# Altium schematic sheet POWER - SYSTEM POWER.schdoc
size 420 x 298 mm; Symbol: Sheet-Symbol_A3; Company: 嘉立创EDA; Version: V1.0; Page Size: A3; @Project Name: 【全网首发】X86电脑主板_copy; @Page Count: 27; @Update Date: 2025-10-09; @Create Date: 2025-10-09; @Schematic Name: SCHEMATIC1_1; @Page No: 0; @Page Name: POWER - SYSTEM POWER; Device: Sheet-Symbol_A3
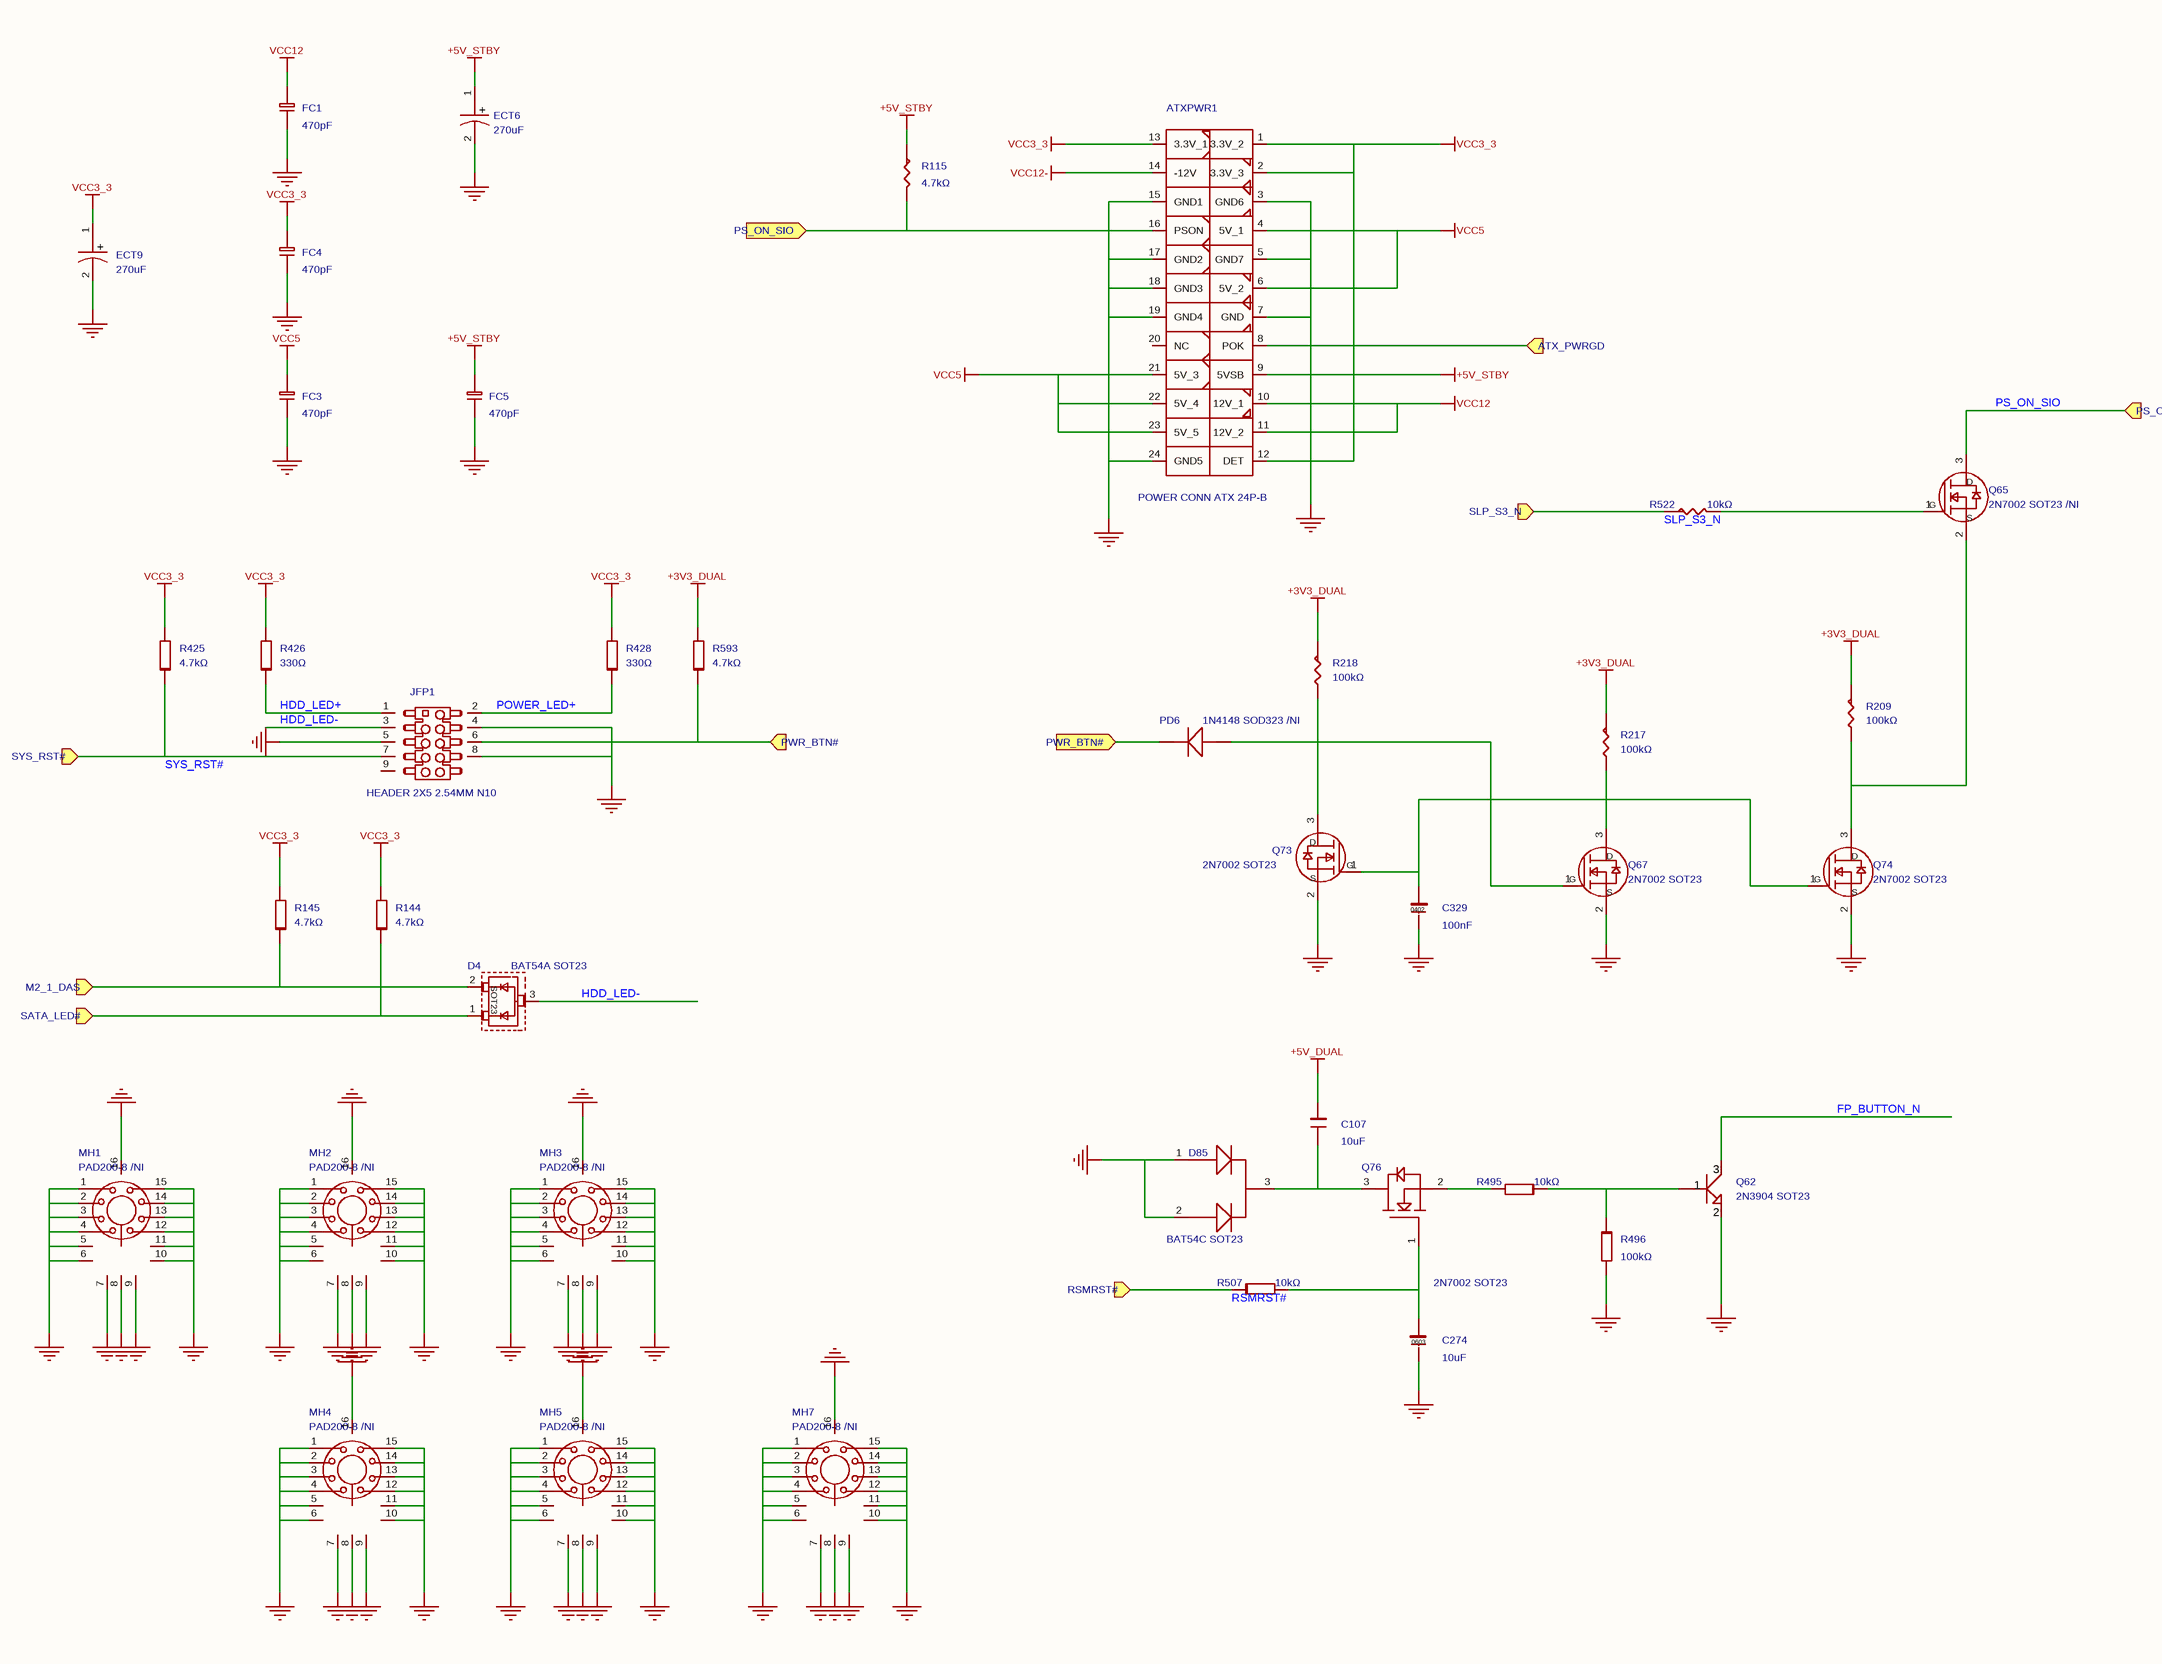
[diagram p0: POWER - SYSTEM POWER.schdoc]

## Parts
ATXPWR1  value POWER CONN ATX 24P-B  [POWER-PSU-20051014]  (hidden comment: 4-5099-8)
C107  10uF  [C0603_3]
C274  10uF  [C0603_3]
C329  100nF  [C0402]
D4  value BAT54A SOT23  [SOT23_123]  (hidden comment: BAT54A)
D85  value BAT54C SOT23  [SOT23_125]  (hidden comment: BAT54C)
ECT6  270uF  [EC1P25C_2]
ECT9  270uF  [EC1P25C_2]
FC1  470pF  [C0402_1]
FC3  470pF  [C0402_3]
FC4  470pF  [C0402_1]
FC5  470pF  [C0402_3]
JFP1  value HEADER 2X5 2.54MM N10  [PIN2X5_2D54_NC10_1]  (hidden comment: 210-92-05GB02)
MH1  value PAD200-8 /NI  [MTH_156A]  (hidden comment: Mounting Hole_0)
MH2  value PAD200-8 /NI  [MTH_156A]  (hidden comment: Mounting Hole_0)
MH3  value PAD200-8 /NI  [MTH_156A]  (hidden comment: Mounting Hole_0)
MH4  value PAD200-8 /NI  [MTH_156A]  (hidden comment: Mounting Hole_0)
MH5  value PAD200-8 /NI  [MTH_156A_1]  (hidden comment: Mounting Hole_0)
MH7  value PAD200-8 /NI  [MTH_156A_2]  (hidden comment: Mounting Hole_0)
PD6  value 1N4148 SOD323 /NI  [1N4148WS-7-SOD323]  (hidden comment: DIODE_1)
Q62  value 2N3904 SOT23  [SOT23_125]  (hidden comment: 2N3904S-RTK/PS)
Q65  value 2N7002 SOT23 /NI  [SOT23_125]  (hidden comment: NMOSFET SOT-23_0)
Q67  value 2N7002 SOT23  [SOT23_125]  (hidden comment: 2N7002)
Q73  value 2N7002 SOT23  [SOT23_126]  (hidden comment: 2N7002)
Q74  value 2N7002 SOT23  [SOT23_125]  (hidden comment: 2N7002)
Q76  value 2N7002 SOT23  [SOT23_125]  (hidden comment: 2N7002)
R115  4.7kΩ  [R0402_1]
R144  4.7kΩ  [R0402_1]
R145  4.7kΩ  [R0402_3]
R209  100kΩ  [R0402_1]
R217  100kΩ  [R0402]
R218  100kΩ  [R0402_1]
R425  4.7kΩ  [R0402_1]
R426  330Ω  [R0402_1]
R428  330Ω  [R0402_1]
R495  10kΩ  [R0402_3]
R496  100kΩ  [R0402_3]
R507  10kΩ  [R0402]
R522  10kΩ  [R0402_2]
R593  4.7kΩ  [R0402_1]

## Ports
ATX_PWRGD (in), M2_1_DAS (in), PS_ON_SIO (in), PWR_BTN# (in), RSMRST# (in), SATA_LED# (in), SLP_S3_N (in), SYS_RST# (in)

## Nets
+3V3_DUAL: R209.1 R217.1 R218.1 R593.2
+5V_DUAL: C107.1
+5V_STBY: ATXPWR1.9(5VSB) ECT6.1 FC5.1 R115.1
GND: ATXPWR1.3(GND6) ATXPWR1.5(GND7) ATXPWR1.7(GND) ATXPWR1.15(GND1) ATXPWR1.17(GND2) ATXPWR1.18(GND3) ATXPWR1.19(GND4) ATXPWR1.24(GND5) C274.2 C329.2 D85.1(A1) D85.2(A2) ECT6.2 ECT9.2 FC1.2 FC3.2 FC4.2 FC5.2 JFP1.4 JFP1.5 JFP1.8 MH1.1 MH1.2 MH1.3 MH1.4 MH1.5 MH1.6 MH1.7 MH1.8 MH1.9 MH1.10 MH1.11 MH1.12 MH1.13 MH1.14 MH1.15 MH1.16 MH2.1 MH2.2 MH2.3 MH2.4 MH2.5 MH2.6 MH2.7 MH2.8 MH2.9 MH2.10 MH2.11 MH2.12 MH2.13 MH2.14 MH2.15 MH2.16 MH3.1 MH3.2 MH3.3 MH3.4 MH3.5 MH3.6 MH3.7 MH3.8 MH3.9 MH3.10 MH3.11 MH3.12 MH3.13 MH3.14 MH3.15 MH3.16 MH4.1 MH4.2 MH4.3 MH4.4 MH4.5 MH4.6 MH4.7 MH4.8 MH4.9 MH4.10 MH4.11 MH4.12 MH4.13 MH4.14 MH4.15 MH4.16 MH5.1 MH5.2 MH5.3 MH5.4 MH5.5 MH5.6 MH5.7 MH5.8 MH5.9 MH5.10 MH5.11 MH5.12 MH5.13 MH5.14 MH5.15 MH5.16 MH7.1 MH7.2 MH7.3 MH7.4 MH7.5 MH7.6 MH7.7 MH7.8 MH7.9 MH7.10 MH7.11 MH7.12 MH7.13 MH7.14 MH7.15 MH7.16 Q62.2(E) Q67.2(S) Q73.2(S) Q74.2(S) R496.2
VCC3_3: ATXPWR1.1(3.3V_2) ATXPWR1.2(3.3V_3) ATXPWR1.12(DET) ATXPWR1.13(3.3V_1) ECT9.1 FC4.1 R144.2 R145.2 R425.2 R426.2 R428.2
VCC5: ATXPWR1.4(5V_1) ATXPWR1.6(5V_2) ATXPWR1.21(5V_3) ATXPWR1.22(5V_4) ATXPWR1.23(5V_5) FC3.1
VCC12: ATXPWR1.10(12V_1) ATXPWR1.11(12V_2) FC1.1
VCC12-: ATXPWR1.14(-12V)
ATX_PWRGD: ATXPWR1.8(POK) ; port ATX_PWRGD
FP_BUTTON_N: Q62.3(C)
HDD_LED+: JFP1.1 R426.1
HDD_LED-: D4.3 JFP1.3
M2_1_DAS: D4.2 R145.1 ; port M2_1_DAS
POWER_LED+: JFP1.2 R428.1
PS_ON_SIO: ATXPWR1.16(PSON) Q65.3(D) R115.2 ; port PS_ON_SIO
PWR_BTN#: JFP1.6 PD6.1(C) R593.1 ; port PWR_BTN#
RSMRST#: R507.1 ; port RSMRST#
SATA_LED#: D4.1 R144.1 ; port SATA_LED#
SLP_S3_N: R522.1 ; port SLP_S3_N
SYS_RST#: JFP1.7 R425.1 ; port SYS_RST#
NetC107_2: C107.2 D85.3(C) Q76.3(DRAIN)
NetC274_1: C274.1 Q76.1(GATE) R507.2
NetC329_1: C329.1 Q67.3(D) Q73.1(G) Q74.1(G) R217.2
NetPD6_2: PD6.2(A) Q67.1(G) Q73.3(D) R218.2
NetQ62_1: Q62.1(B) R495.1 R496.1
NetQ65_1: Q65.1(G) R522.2
NetQ65_2: Q65.2(S) Q74.3(D) R209.2
NetQ76_2: Q76.2(SOURCE) R495.2

Not connected (* = marked no-connect by the designer): ATXPWR1 20(NC); JFP1 9

## Notes on the sheet
- 更新日期
- 2025-10-09
- 原理图
- 图页
- SCHEMATIC1_1
- POWER - SYSTEM POWER
- 创建日期
- 物料编码
- 审阅
- 绘制
- 【全网首发】X86电脑主板_copy
- 版本
- V1.0
- 尺寸
- A3
- 页
- 0
- 嘉立创EDA
- 共
- 27
- (in symbol 160AREC271M0609) +
- (in symbol BAT54A_C727124) SOT23
- (in symbol CL05A106MQ5NUNC) 0603

## Library data of the parts
ATXPWR1 = 4-5099-8: 插针结构:2x12P;间距:4.2mm;安装方式:直插;参考系列:-;总PIN数:24P;排数:2;每排PIN数:12;行距:4.2mm;额定电流:9A;触头材质:黄铜;触头镀层:锡;工作温度范围:-25℃~+85℃;; Manufacturer: UMaxconn(友贸); Symbol: JATXPWR_0; AddInBom: yes; ModelId: 1f8e9fb6d80c412b94c4fc3963e9c297; ModelName: CONN-TH_4-5099-8; ModelTransform: 2041.334,429.133,0,0,0,0,-5.906,-25.591,-137.795; Pins Structure: 2x12P; Pitch: 4.2mm; Number of PINs Per Row: 12; Current Rating (Max): 9A; Device: 4-5099-8; LCSC Part Name: 2x12P 间距:4.2mm 直插; SupplierPart: C601194; ManufacturerPart: 4-5099-8; Supplier Footprint: 插件,P=4.2mm; JLCPCB Part Class: Extended Part; Datasheet: https://atta.szlcsc.com/upload/public/pdf/source/20200609/C601194_F0EB05AF17C99BA2D6678257B7A60494.pdf; Supplier: LCSC; ConvertToPcb: yes; FootprintName: POWER-PSU-20051014; Mounting Style: 直插; Reference Series: -; Number of Pins: 24P; Number of Rows: 2; Row Spacing: 4.2mm; Contact Material: 黄铜; Contact Plating: 锡; Operating Temperature Range: -25℃~+85℃
C107 = CL10A106MQ8NNNC: 容值:10uF;精度:±20%;额定电压:6.3V;材质(温度系数):X5R;; Manufacturer: SAMSUNG(三星); Symbol: C0805; ModelId: ac125912035d415993ca9572d50418b1; Tolerance: ±20%; AddInBom: yes; Voltage Rated: 6.3V; ModelName: C0603_L1.6-W0.8-H0.8; ModelTransform: 62.992,31.496,0,0,0,0,0,0,0; Temperature Coefficient: X5R; Device: CL10A106MQ8NNNC; Value: 10uF; Supplier: LCSC; Datasheet: https://atta.szlcsc.com/upload/public/pdf/source/20160103/1457707690948.pdf; FootprintName: C0603_3; SupplierPart: C1691; ConvertToPcb: yes; LCSC Part Name: 10uF ±20% 6.3V; JLCPCB Part Class: Extended Part; ManufacturerPart: CL10A106MQ8NNNC; Supplier Footprint: 0603
C274 = CL05A106MQ5NUNC: 容值:10uF;精度:±20%;额定电压:6.3V;材质(温度系数):X5R;; Manufacturer: SAMSUNG(三星); Symbol: C0603; ModelId: 36a51122f27c49738f86b3bfa98863e0; Tolerance: ±20%; AddInBom: yes; Voltage Rated: 6.3V; ModelName: C0402_L1.0-W0.5-H0.5; ModelTransform: 39.37,19.685,0,0,0,0,0,0,0; Temperature Coefficient: X5R; Device: CL05A106MQ5NUNC; Value: 10uF; Supplier: LCSC; Datasheet: https://atta.szlcsc.com/upload/public/pdf/source/20220823/2B02EE04F8F211D38A52DCB16EB6BEBA.pdf; FootprintName: C0603_3; SupplierPart: C15525; ConvertToPcb: yes; LCSC Part Name: 10uF ±20% 6.3V; JLCPCB Part Class: Basic Part; ManufacturerPart: CL05A106MQ5NUNC; Supplier Footprint: 0402
C329 = CL05B104KO5NNNC: 容值:100nF;精度:±10%;额定电压:16V;材质(温度系数):X7R;; Manufacturer: SAMSUNG(三星); ModelId: 36a51122f27c49738f86b3bfa98863e0; Tolerance: ±10%; AddInBom: yes; Voltage Rated: 16V; ModelName: C0402_L1.0-W0.5-H0.5; ModelTransform: 39.37,19.685,0,0,0,0,0,0,0; Temperature Coefficient: X7R; Device: CL05B104KO5NNNC; Symbol: C0402; Value: 100nF; Supplier: LCSC; Datasheet: https://atta.szlcsc.com/upload/public/pdf/source/20160103/1457707674891.pdf; FootprintName: C0402; SupplierPart: C1525; ConvertToPcb: yes; LCSC Part Name: 100nF ±10% 16V; JLCPCB Part Class: Basic Part; ManufacturerPart: CL05B104KO5NNNC; Supplier Footprint: 0402
D4 = BAT54A_C727124: 二极管配置:1对共阳极;正向压降(Vf):1V@100mA;直流反向耐压(Vr):30V;平均整流电流(Io):200mA;; Manufacturer: TWGMC(台湾迪嘉); AddInBom: yes; ModelId: c62791f0466c4ae2a892c056b845b0ca; ModelName: SOT-23-3P_L2.9-W1.3-H1.0-LS2.4-P0.95; ModelTransform: 98.425,114.173,0,180,0,0,0.0005,-0.0005,0; Diode Configuration: 1对共阳极; Reverse Voltage (Vr): 30V; Average Rectified Current (Io): 200mA; Reverse Leakage Current (Ir): 2uA@25V; Device: BAT54A_C727124; Symbol: BAT54A; LCSC Part Name: 电压:30V 电流:200mA; SupplierPart: C727124; ManufacturerPart: BAT54A; Supplier Footprint: SOT-23; JLCPCB Part Class: Extended Part; Datasheet: https://atta.szlcsc.com/upload/public/pdf/source/20200827/C727124_5D482B6B1AEFE8F49931502BEAC75010.pdf; Supplier: LCSC; ConvertToPcb: yes; FootprintName: SOT23_123; Forward Voltage (Vf@If): 1V@100mA
D85 = BAT54C_C2135: 二极管配置:-;直流反向耐压(Vr):30V;平均整流电流(Io):200mA;正向压降(Vf):1V@100mA;; Manufacturer: CJ(江苏长电/长晶); Symbol: BAT54C_1; ModelId: 89cb27a44ab2466697082bb9fd73a7d0; AddInBom: yes; ModelName: SOT-23-3L_L2.9-W1.6-H1.1-LS2.8-P0.95; ModelTransform: 110.236,114.173,0,180,0,0,-0.005,0.0005,0; Reverse Voltage (Vr): 30V; Average Rectified Current (Io): 200mA; Device: BAT54C_C2135; Supplier: LCSC; Datasheet: https://atta.szlcsc.com/upload/public/pdf/source/20140809/1457707208935.pdf; FootprintName: SOT23_125; SupplierPart: C2135; ConvertToPcb: yes; LCSC Part Name: 30V 200mA 1V@100mA; JLCPCB Part Class: Extended Part; ManufacturerPart: BAT54C; Supplier Footprint: SOT-23; Diode Configuration: -; Forward Voltage (Vf@If): 1V@100mA; Reverse Leakage Current (Ir): -
ECT6 ECT9 = 160AREC271M0609: 容值:270uF;精度:±20%;额定电压:16V;纹波电流:3.8A@100kHz;等效串联电阻:15mΩ@100kHz~300kHz;类型:-;; Manufacturer: APAQ(钰邦); Symbol: CAPACITOR POL_0; AddInBom: yes; ModelId: 0a4db4bf24b443b3be4905be97ff10c5; ModelName: CAP-TH_BD6.3-P2.50-D1.0-FD; ModelTransform: 248.4247,247.99777,0,0,0,0,0,0,-137.795; Tolerance: ±20%; Rated Voltage: 16V; φD: 6.3mm; L: 9mm; Lifetime @ Temp: 2000hrs@105℃; Device: 160AREC271M0609; Value: 270uF; LCSC Part Name: 270uF ±20% 16V; SupplierPart: C176312; ManufacturerPart: 160AREC271M0609; Supplier Footprint: 插件,D6.3xL9mm; JLCPCB Part Class: Extended Part; Datasheet: https://atta.szlcsc.com/upload/public/pdf/source/20180420/C176312_A6CC051F3F5535015096354530D22B11.pdf; Supplier: LCSC; ConvertToPcb: yes; FootprintName: EC1P25C_2; Ripple Current: 3.8A@100kHz; Equivalent Series Resistance(ESR): 15mΩ@100kHz~300kHz; Type: -; Lead Spacing: 2.5mm; Operating Temperature: -55℃~+105℃
FC1 FC3-FC5 = CC0402KRX7R9BB471: 容值:470pF;精度:±10%;额定电压:50V;材质(温度系数):X7R;; Manufacturer: YAGEO(国巨); Symbol: CAP_3; ModelId: 36a51122f27c49738f86b3bfa98863e0; Tolerance: ±10%; AddInBom: yes; Voltage Rated: 50V; ModelName: C0402_L1.0-W0.5-H0.5; ModelTransform: 39.37,19.685,0,0,0,0,0,0,0; Temperature Coefficient: X7R; Device: CC0402KRX7R9BB471; Value: 470pF; Supplier: LCSC; Datasheet: https://atta.szlcsc.com/upload/public/pdf/source/20180326/C106207_C8E11B327C525CD8FD8634FC1E16A93A.pdf; SupplierPart: C106207; ConvertToPcb: yes; LCSC Part Name: 470pF ±10% 50V; JLCPCB Part Class: Extended Part; ManufacturerPart: CC0402KRX7R9BB471; Supplier Footprint: 0402
  FC1 FC4: FootprintName: C0402_1
  FC3 FC5: FootprintName: C0402_3
JFP1 = 210-92-05GB02: 插针结构:2x5P;间距:2.54mm;行距:2.54mm;圆针/方针:方针;安装类型:直插;排数:双排;总PIN位数:10P;额定电流:3A;额定电压:-;配合针长度:6.1mm;塑高:2.5mm;端接针长度:3mm;触头材质:黄铜;触头镀层:-;工作温度范围:-40℃~+105℃;颜色:黑色;; Manufacturer: PINREX(频锐科技); Symbol: PIN HEADER 2X7 2_0.54; AddInBom: yes; ModelId: 4a96607ad93f48408c2a0a6543c48f7d; ModelName: HDR-TH_9P-P2.54-M-LI-2X5P; ModelTransform: 490.157,196.85,0,0,0,0,0,0,-118.11; Pin Structure: 2x5P; Pitch: 2.54mm; Circluar Pins/Square Pins: 方针; Current Rating (Max): 3A; Device: 210-92-05GB02; JLCPCB Part Class: Extended Part; LCSC Part Name: 间距:2.54mm 2x5P 直插 方针 黑金; SupplierPart: C390689; ManufacturerPart: 210-92-05GB02; Supplier Footprint: 插件,P=2.54mm; Datasheet: https://atta.szlcsc.com/upload/public/pdf/source/20190506/C390689_DC56D71BCD7C484749B58F96D2D2D6C5.pdf; Supplier: LCSC; ConvertToPcb: yes; FootprintName: PIN2X5_2D54_NC10_1; Row Spacing: 2.54mm; Mounting Type: 直插; Number of Rows: 双排; Number of Pins: 10P; Voltage Rating (Max): -; Length of Mating Pin: 6.1mm; Insulation Height: 2.5mm; Length of End Connection Pin: 3mm; Contact Material: 黄铜; Contact Plating: -; Operating Temperature Range: -40℃~+105℃; Color: 黑色
MH1-MH4 = Mounting Hole_0: Check: false; AddInBom: yes; Device: Mounting Hole_0; Symbol: Mounting Hole_0; FootprintName: MTH_156A; ConvertToPcb: yes
MH5 = Mounting Hole_1: Check: false; AddInBom: yes; Device: Mounting Hole_1; Symbol: Mounting Hole_0; FootprintName: MTH_156A_1; ConvertToPcb: yes
MH7 = Mounting Hole_2: Check: false; AddInBom: yes; Device: Mounting Hole_2; Symbol: Mounting Hole_0; FootprintName: MTH_156A_2; ConvertToPcb: yes
PD6 = DIODE_1: Manufacturer: JSMSEMI(杰盛微); Manufacturer Part: 1N4148WS; 3D Model: e9dd044ee7bf4221b3b795eb56bce7c0; 3D Model Transform: 98.91933,51.181,0,180,0,0,0.985,-0.0005,0; Diode Configuration: 独立式; Forward Voltage (Vf@If): 1.25V@150mA; Reverse Voltage (Vr): 100V; Average Rectified Current (Io): 300mA; Power Dissipation: 400mW; Reverse Leakage Current: 1uA@75V; Reverse Recovery Time (trr): 8ns; AddInBom: yes; Device: DIODE_1; Symbol: DIODE_1; LCSC Part Name: 电压:100V 电流:300mA; Supplier Part: C917117; Supplier Footprint: SOD-323; JLCPCB Part Class: Extended Part; Datasheet: https://atta.szlcsc.com/upload/public/pdf/source/20230807/08D9F448A82EA88A23B325A669586A09.pdf; Supplier: LCSC; Operating Temperature: -55℃~+150℃@(Tj); FootprintName: 1N4148WS-7-SOD323; ConvertToPcb: yes
Q62 = 2N3904S-RTK/PS: 晶体管类型:NPN;集射极击穿电压(Vceo):40V;集电极电流(Ic):200mA;功率(Pd):350mW;直流电流增益(hFE@Ic,Vce):100@10mA,1V;; Manufacturer: KEC; Symbol: T_NPN; ModelId: c62791f0466c4ae2a892c056b845b0ca; AddInBom: yes; ModelName: SOT-23-3P_L2.9-W1.3-H1.0-LS2.4-P0.95; Transistor Type: NPN; ModelTransform: 98.64468,114.173,0,180,0,0,0,0,0; Collector Current (Ic): 200mA; Power Dissipation (Pd): 350mW; Transition Frequency (fT): 300MHz; Collector-Emitter Breakdown Voltage (Vceo): 40V; Collector-Emitter Saturation Voltage (VCE(sat)@Ic,Ib): 300mV@50mA,5mA; Device: 2N3904S-RTK/PS; Supplier: LCSC; Datasheet: https://atta.szlcsc.com/upload/public/pdf/source/20160416/1460799387204.pdf; FootprintName: SOT23_125; SupplierPart: C18536; ConvertToPcb: yes; LCSC Part Name: NPN 40V 200mA; JLCPCB Part Class: Extended Part; ManufacturerPart: 2N3904S-RTK/PS; Supplier Footprint: SOT-23; Operating Temperature: +150℃@(Tj); DC Current Gain (hFE@Ic,Vce): 100@10mA,1V; Collector Cut-Off Current (Icbo): -
Q65 = NMOSFET SOT-23_0: Check: false; AddInBom: yes; Device: NMOSFET SOT-23_0; Symbol: NMOSFET SOT-23_0; FootprintName: SOT23_125; ConvertToPcb: yes
Q67 Q73 Q74 = 2N7002_C8545: 类型:N沟道;漏源电压(Vdss):60V;连续漏极电流(Id):115mA;功率(Pd):200mW;导通电阻(RDS(on)@Vgs,Id):7.5Ω@10V,500mA;阈值电压(Vgs(th)@Id):2.5V@250uA;; Manufacturer: CJ(江苏长电/长晶); Symbol: NMOSFET SOT-23_0; Type: N沟道; ModelId: c62791f0466c4ae2a892c056b845b0ca; AddInBom: yes; ModelName: SOT-23-3P_L2.9-W1.3-H1.0-LS2.4-P0.95; ModelTransform: 98.425,114.173,0,180,0,0,0.0005,-0.0005,0; Power Dissipation (Pd): 200mW; Drain Source Voltage (Vdss): 60V; Continuous Drain Current (Id): 115mA; Device: 2N7002_C8545; Supplier: LCSC; Datasheet: https://atta.szlcsc.com/upload/public/pdf/source/20170302/1488422688078.pdf; SupplierPart: C8545; ConvertToPcb: yes; LCSC Part Name: N沟道 60V 115mA; JLCPCB Part Class: Basic Part; ManufacturerPart: 2N7002; Supplier Footprint: SOT-23; Gate Threshold Voltage (Vgs(th)@Id): 2.5V@250uA; Drain Source On Resistance (RDS(on)@Vgs,Id): 7.5Ω@10V,500mA
  Q67 Q74: FootprintName: SOT23_125
  Q73: FootprintName: SOT23_126
Q76 = 2N7002_C8545: 类型:N沟道;漏源电压(Vdss):60V;连续漏极电流(Id):115mA;功率(Pd):200mW;导通电阻(RDS(on)@Vgs,Id):7.5Ω@10V,500mA;阈值电压(Vgs(th)@Id):2.5V@250uA;; Manufacturer: CJ(江苏长电/长晶); Symbol: MOSFET_N; Type: N沟道; ModelId: c62791f0466c4ae2a892c056b845b0ca; AddInBom: yes; ModelName: SOT-23-3P_L2.9-W1.3-H1.0-LS2.4-P0.95; ModelTransform: 98.425,114.173,0,180,0,0,0.0005,-0.0005,0; Power Dissipation (Pd): 200mW; Drain Source Voltage (Vdss): 60V; Continuous Drain Current (Id): 115mA; Device: 2N7002_C8545; Supplier: LCSC; Datasheet: https://atta.szlcsc.com/upload/public/pdf/source/20170302/1488422688078.pdf; FootprintName: SOT23_125; SupplierPart: C8545; ConvertToPcb: yes; LCSC Part Name: N沟道 60V 115mA; JLCPCB Part Class: Basic Part; ManufacturerPart: 2N7002; Supplier Footprint: SOT-23; Gate Threshold Voltage (Vgs(th)@Id): 2.5V@250uA; Drain Source On Resistance (RDS(on)@Vgs,Id): 7.5Ω@10V,500mA
R115 = 0402WGF4701TCE: 电阻类型:厚膜电阻;阻值:4.7kΩ;精度:±1%;功率:62.5mW;; Manufacturer: UNI-ROYAL(厚声); Symbol: R; ModelId: 671aefced39d4c318694bba8bd8efd39; Tolerance: ±1%; AddInBom: yes; Power(Watts): 62.5mW; ModelName: R0402_L1.0-W0.5-H0.5; ModelTransform: 39.37,19.685,0,0,0,0,0,0.0005,0; Overload Voltage (Max): 50V; Temperature Coefficient: ±100ppm/℃; Device: 0402WGF4701TCE; Value: 4.7kΩ; Type: 厚膜电阻; Supplier: LCSC; Datasheet: https://atta.szlcsc.com/upload/public/pdf/source/20200306/C422600_1E6D84923E4A46A82E41ADD87F860B5C.pdf; FootprintName: R0402_1; SupplierPart: C25900; ConvertToPcb: yes; LCSC Part Name: 4.7kΩ ±1% 62.5mW; JLCPCB Part Class: Basic Part; ManufacturerPart: 0402WGF4701TCE; Supplier Footprint: 0402; Operating Temperature Range: -55℃~+155℃
R144 R145 R425 R593 = 0402WGF4701TCE: 电阻类型:厚膜电阻;阻值:4.7kΩ;精度:±1%;功率:62.5mW;; Manufacturer: UNI-ROYAL(厚声); Symbol: R0402; ModelId: 671aefced39d4c318694bba8bd8efd39; Tolerance: ±1%; AddInBom: yes; Power(Watts): 62.5mW; ModelName: R0402_L1.0-W0.5-H0.5; ModelTransform: 39.37,19.685,0,0,0,0,0,0.0005,0; Overload Voltage (Max): 50V; Temperature Coefficient: ±100ppm/℃; Device: 0402WGF4701TCE; Value: 4.7kΩ; Type: 厚膜电阻; Supplier: LCSC; Datasheet: https://atta.szlcsc.com/upload/public/pdf/source/20200306/C422600_1E6D84923E4A46A82E41ADD87F860B5C.pdf; SupplierPart: C25900; ConvertToPcb: yes; LCSC Part Name: 4.7kΩ ±1% 62.5mW; JLCPCB Part Class: Basic Part; ManufacturerPart: 0402WGF4701TCE; Supplier Footprint: 0402; Operating Temperature Range: -55℃~+155℃
  R144 R425 R593: FootprintName: R0402_1
  R145: FootprintName: R0402_3
R209 R217 R218 = 0402WGF1003TCE: 电阻类型:厚膜电阻;阻值:100kΩ;精度:±1%;功率:62.5mW;; Manufacturer: UNI-ROYAL(厚声); Symbol: R-0603; ModelId: 671aefced39d4c318694bba8bd8efd39; Tolerance: ±1%; AddInBom: yes; Power(Watts): 62.5mW; ModelName: R0402_L1.0-W0.5-H0.5; ModelTransform: 39.37,19.685,0,0,0,0,0,0.0005,0; Overload Voltage (Max): 50V; Temperature Coefficient: ±100ppm/℃; Device: 0402WGF1003TCE; Value: 100kΩ; Type: 厚膜电阻; Supplier: LCSC; Datasheet: https://atta.szlcsc.com/upload/public/pdf/source/20200306/C422600_1E6D84923E4A46A82E41ADD87F860B5C.pdf; SupplierPart: C25741; ConvertToPcb: yes; LCSC Part Name: 100kΩ ±1% 62.5mW; JLCPCB Part Class: Basic Part; ManufacturerPart: 0402WGF1003TCE; Supplier Footprint: 0402; Operating Temperature Range: -55℃~+155℃
  R209 R218: FootprintName: R0402_1
  R217: FootprintName: R0402
R426 R428 = 0402WGF3300TCE: 电阻类型:厚膜电阻;阻值:330Ω;精度:±1%;功率:62.5mW;; Manufacturer: UNI-ROYAL(厚声); Symbol: R0402; ModelId: 671aefced39d4c318694bba8bd8efd39; Tolerance: ±1%; AddInBom: yes; Power(Watts): 62.5mW; ModelName: R0402_L1.0-W0.5-H0.5; ModelTransform: 39.37,19.685,0,0,0,0,0,0.0005,0; Overload Voltage (Max): 50V; Temperature Coefficient: ±100ppm/℃; Device: 0402WGF3300TCE; Value: 330Ω; Type: 厚膜电阻; Supplier: LCSC; Datasheet: https://atta.szlcsc.com/upload/public/pdf/source/20200306/C422600_1E6D84923E4A46A82E41ADD87F860B5C.pdf; FootprintName: R0402_1; SupplierPart: C25104; ConvertToPcb: yes; LCSC Part Name: 330Ω ±1% 62.5mW; JLCPCB Part Class: Basic Part; ManufacturerPart: 0402WGF3300TCE; Supplier Footprint: 0402; Operating Temperature Range: -55℃~+155℃
R495 = 0402WGF1002TCE: 电阻类型:厚膜电阻;阻值:10kΩ;精度:±1%;功率:62.5mW;; Manufacturer: UNI-ROYAL(厚声); Symbol: R0402; ModelId: 671aefced39d4c318694bba8bd8efd39; Tolerance: ±1%; AddInBom: yes; Power(Watts): 62.5mW; ModelName: R0402_L1.0-W0.5-H0.5; ModelTransform: 39.37,19.685,0,0,0,0,0,0.0005,0; Overload Voltage (Max): 50V; Temperature Coefficient: ±100ppm/℃; Device: 0402WGF1002TCE; Value: 10kΩ; Type: 厚膜电阻; Supplier: LCSC; Datasheet: https://atta.szlcsc.com/upload/public/pdf/source/20200306/C422600_1E6D84923E4A46A82E41ADD87F860B5C.pdf; FootprintName: R0402_3; SupplierPart: C25744; ConvertToPcb: yes; LCSC Part Name: 10kΩ ±1% 62.5mW; JLCPCB Part Class: Basic Part; ManufacturerPart: 0402WGF1002TCE; Supplier Footprint: 0402; Operating Temperature Range: -55℃~+155℃
R496 = 0402WGF1003TCE: 电阻类型:厚膜电阻;阻值:100kΩ;精度:±1%;功率:62.5mW;; Manufacturer: UNI-ROYAL(厚声); Symbol: R0402; ModelId: 671aefced39d4c318694bba8bd8efd39; Tolerance: ±1%; AddInBom: yes; Power(Watts): 62.5mW; ModelName: R0402_L1.0-W0.5-H0.5; ModelTransform: 39.37,19.685,0,0,0,0,0,0.0005,0; Overload Voltage (Max): 50V; Temperature Coefficient: ±100ppm/℃; Device: 0402WGF1003TCE; Value: 100kΩ; Type: 厚膜电阻; Supplier: LCSC; Datasheet: https://atta.szlcsc.com/upload/public/pdf/source/20200306/C422600_1E6D84923E4A46A82E41ADD87F860B5C.pdf; FootprintName: R0402_3; SupplierPart: C25741; ConvertToPcb: yes; LCSC Part Name: 100kΩ ±1% 62.5mW; JLCPCB Part Class: Basic Part; ManufacturerPart: 0402WGF1003TCE; Supplier Footprint: 0402; Operating Temperature Range: -55℃~+155℃
R507 = 0402WGF1002TCE: 电阻类型:厚膜电阻;阻值:10kΩ;精度:±1%;功率:62.5mW;; Manufacturer: UNI-ROYAL(厚声); ModelId: 671aefced39d4c318694bba8bd8efd39; Tolerance: ±1%; AddInBom: yes; Power(Watts): 62.5mW; ModelName: R0402_L1.0-W0.5-H0.5; ModelTransform: 39.37,19.685,0,0,0,0,0,0.0005,0; Overload Voltage (Max): 50V; Temperature Coefficient: ±100ppm/℃; Device: 0402WGF1002TCE; Symbol: R0402; Value: 10kΩ; Type: 厚膜电阻; Supplier: LCSC; Datasheet: https://atta.szlcsc.com/upload/public/pdf/source/20200306/C422600_1E6D84923E4A46A82E41ADD87F860B5C.pdf; FootprintName: R0402; SupplierPart: C25744; ConvertToPcb: yes; LCSC Part Name: 10kΩ ±1% 62.5mW; JLCPCB Part Class: Basic Part; ManufacturerPart: 0402WGF1002TCE; Supplier Footprint: 0402; Operating Temperature Range: -55℃~+155℃
R522 = 0402WGF1002TCE: 电阻类型:厚膜电阻;阻值:10kΩ;精度:±1%;功率:62.5mW;; Manufacturer: UNI-ROYAL(厚声); Symbol: RESISTOR; ModelId: 671aefced39d4c318694bba8bd8efd39; Tolerance: ±1%; AddInBom: yes; Power(Watts): 62.5mW; ModelName: R0402_L1.0-W0.5-H0.5; ModelTransform: 39.37,19.685,0,0,0,0,0,0.0005,0; Overload Voltage (Max): 50V; Temperature Coefficient: ±100ppm/℃; Device: 0402WGF1002TCE; Value: 10kΩ; Type: 厚膜电阻; Supplier: LCSC; Datasheet: https://atta.szlcsc.com/upload/public/pdf/source/20200306/C422600_1E6D84923E4A46A82E41ADD87F860B5C.pdf; FootprintName: R0402_2; SupplierPart: C25744; ConvertToPcb: yes; LCSC Part Name: 10kΩ ±1% 62.5mW; JLCPCB Part Class: Basic Part; ManufacturerPart: 0402WGF1002TCE; Supplier Footprint: 0402; Operating Temperature Range: -55℃~+155℃